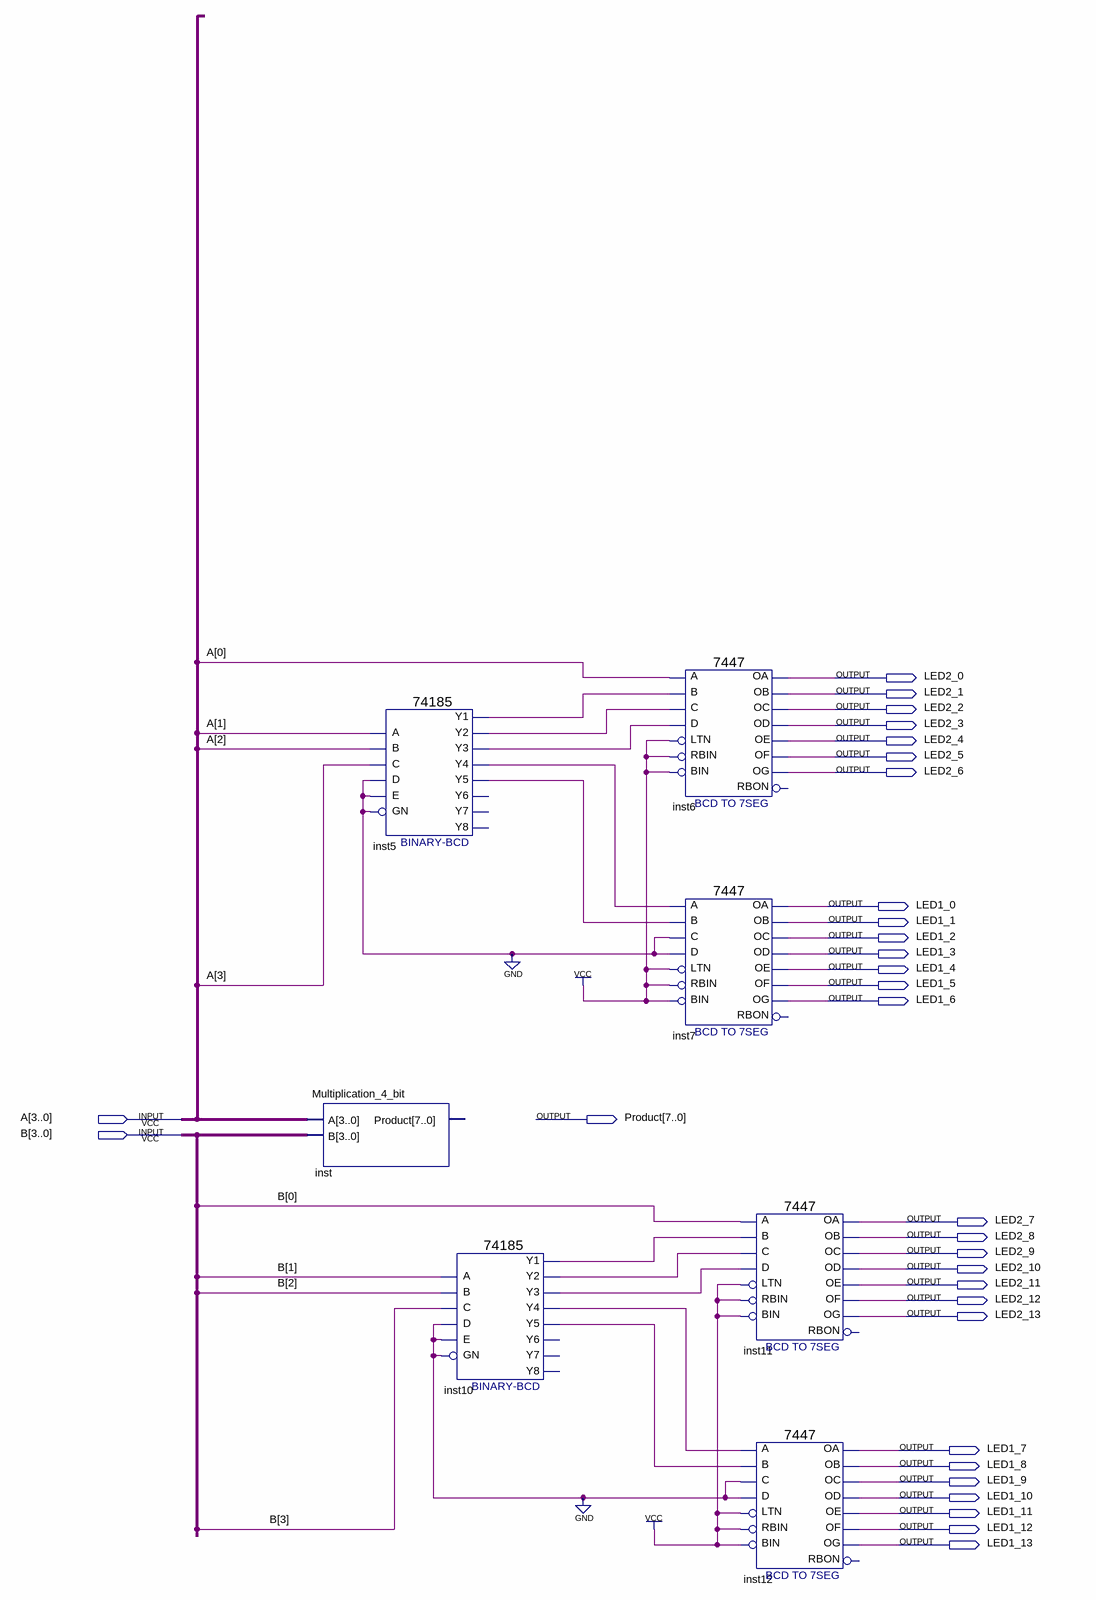
[diagram p0: schematic sheet]
// Quartus schematic Block2.bdf as structural Verilog: 7 symbols, 31 pins
module Block2 (
  input  [3:0] A,
  input  [3:0] B,
  output LED2_0,
  output LED2_1,
  output LED2_2,
  output LED2_3,
  output LED2_4,
  output LED2_5,
  output LED2_6,
  output LED1_0,
  output LED1_1,
  output LED1_2,
  output LED1_3,
  output LED1_4,
  output LED1_5,
  output LED1_6,
  output [7:0] Product,
  output LED2_7,
  output LED2_8,
  output LED2_9,
  output LED2_10,
  output LED2_11,
  output LED2_12,
  output LED2_13,
  output LED1_7,
  output LED1_8,
  output LED1_9,
  output LED1_10,
  output LED1_11,
  output LED1_12,
  output LED1_13
);

  wire inst5_y1, inst5_y2, inst5_y3, inst5_y4, inst5_y5, inst10_y1, inst10_y2, inst10_y3, inst10_y4,
       inst10_y5;

  Multiplication_4_bit inst (.A(A), .B(B));  // open: Product
  \74185  inst5 (
    .A(A[1]), .B(A[2]), .D(1'b0), .C(A[3]), .E(1'b0), .GN(1'b0), .Y1(inst5_y1), .Y3(inst5_y3), .Y2(inst5_y2),
    .Y5(inst5_y5), .Y4(inst5_y4));  // open: Y6, Y8, Y7
  \74185  inst10 (
    .A(B[1]), .B(B[2]), .D(1'b0), .C(B[3]), .E(1'b0), .GN(1'b0), .Y1(inst10_y1), .Y3(inst10_y3),
    .Y2(inst10_y2), .Y5(inst10_y5), .Y4(inst10_y4));  // open: Y6, Y8, Y7
  \7447  inst6 (
    .LTN(1'b1), .B(inst5_y1), .C(inst5_y2), .D(inst5_y3), .RBIN(1'b1), .BIN(1'b1), .A(A[0]), .OB(LED2_1),
    .OC(LED2_2), .OE(LED2_4), .OD(LED2_3), .OF(LED2_5), .OG(LED2_6), .OA(LED2_0));  // open: RBON
  \7447  inst7 (
    .LTN(1'b1), .B(inst5_y5), .C(1'b0), .D(1'b0), .RBIN(1'b1), .BIN(1'b1), .A(inst5_y4), .OB(LED1_1),
    .OC(LED1_2), .OE(LED1_4), .OD(LED1_3), .OF(LED1_5), .OG(LED1_6), .OA(LED1_0));  // open: RBON
  \7447  inst11 (
    .LTN(1'b1), .B(inst10_y1), .C(inst10_y2), .D(inst10_y3), .RBIN(1'b1), .BIN(1'b1), .A(B[0]), .OB(LED2_8),
    .OC(LED2_9), .OE(LED2_11), .OD(LED2_10), .OF(LED2_12), .OG(LED2_13), .OA(LED2_7));  // open: RBON
  \7447  inst12 (
    .LTN(1'b1), .B(inst10_y5), .C(1'b0), .D(1'b0), .RBIN(1'b1), .BIN(1'b1), .A(inst10_y4), .OB(LED1_8),
    .OC(LED1_9), .OE(LED1_11), .OD(LED1_10), .OF(LED1_12), .OG(LED1_13), .OA(LED1_7));  // open: RBON
endmodule
